# Altium schematic sheet DDR4_PWR - +VDDQ_+VTT_+VPP.schdoc
size 594 x 419 mm; Symbol: Sheet-Symbol_A3; Company: 嘉立创EDA; Version: V1.0; Page Size: A3; @Project Name: 【全网首发】X86电脑主板_copy; @Page Count: 28; @Update Date: 2025-10-09; @Create Date: 2025-10-09; @Schematic Name: SCHEMATIC1_1; @Page No: 0; @Page Name: DDR4_PWR - +VDDQ_+VTT_+VPP; Device: Sheet-Symbol_A3; Border: 1; Width: 2338; Height: 1652; Region Start: 1; X Region Count: 6; Y Region Count: 4; Blade Width: 10; Title Block Position: 3
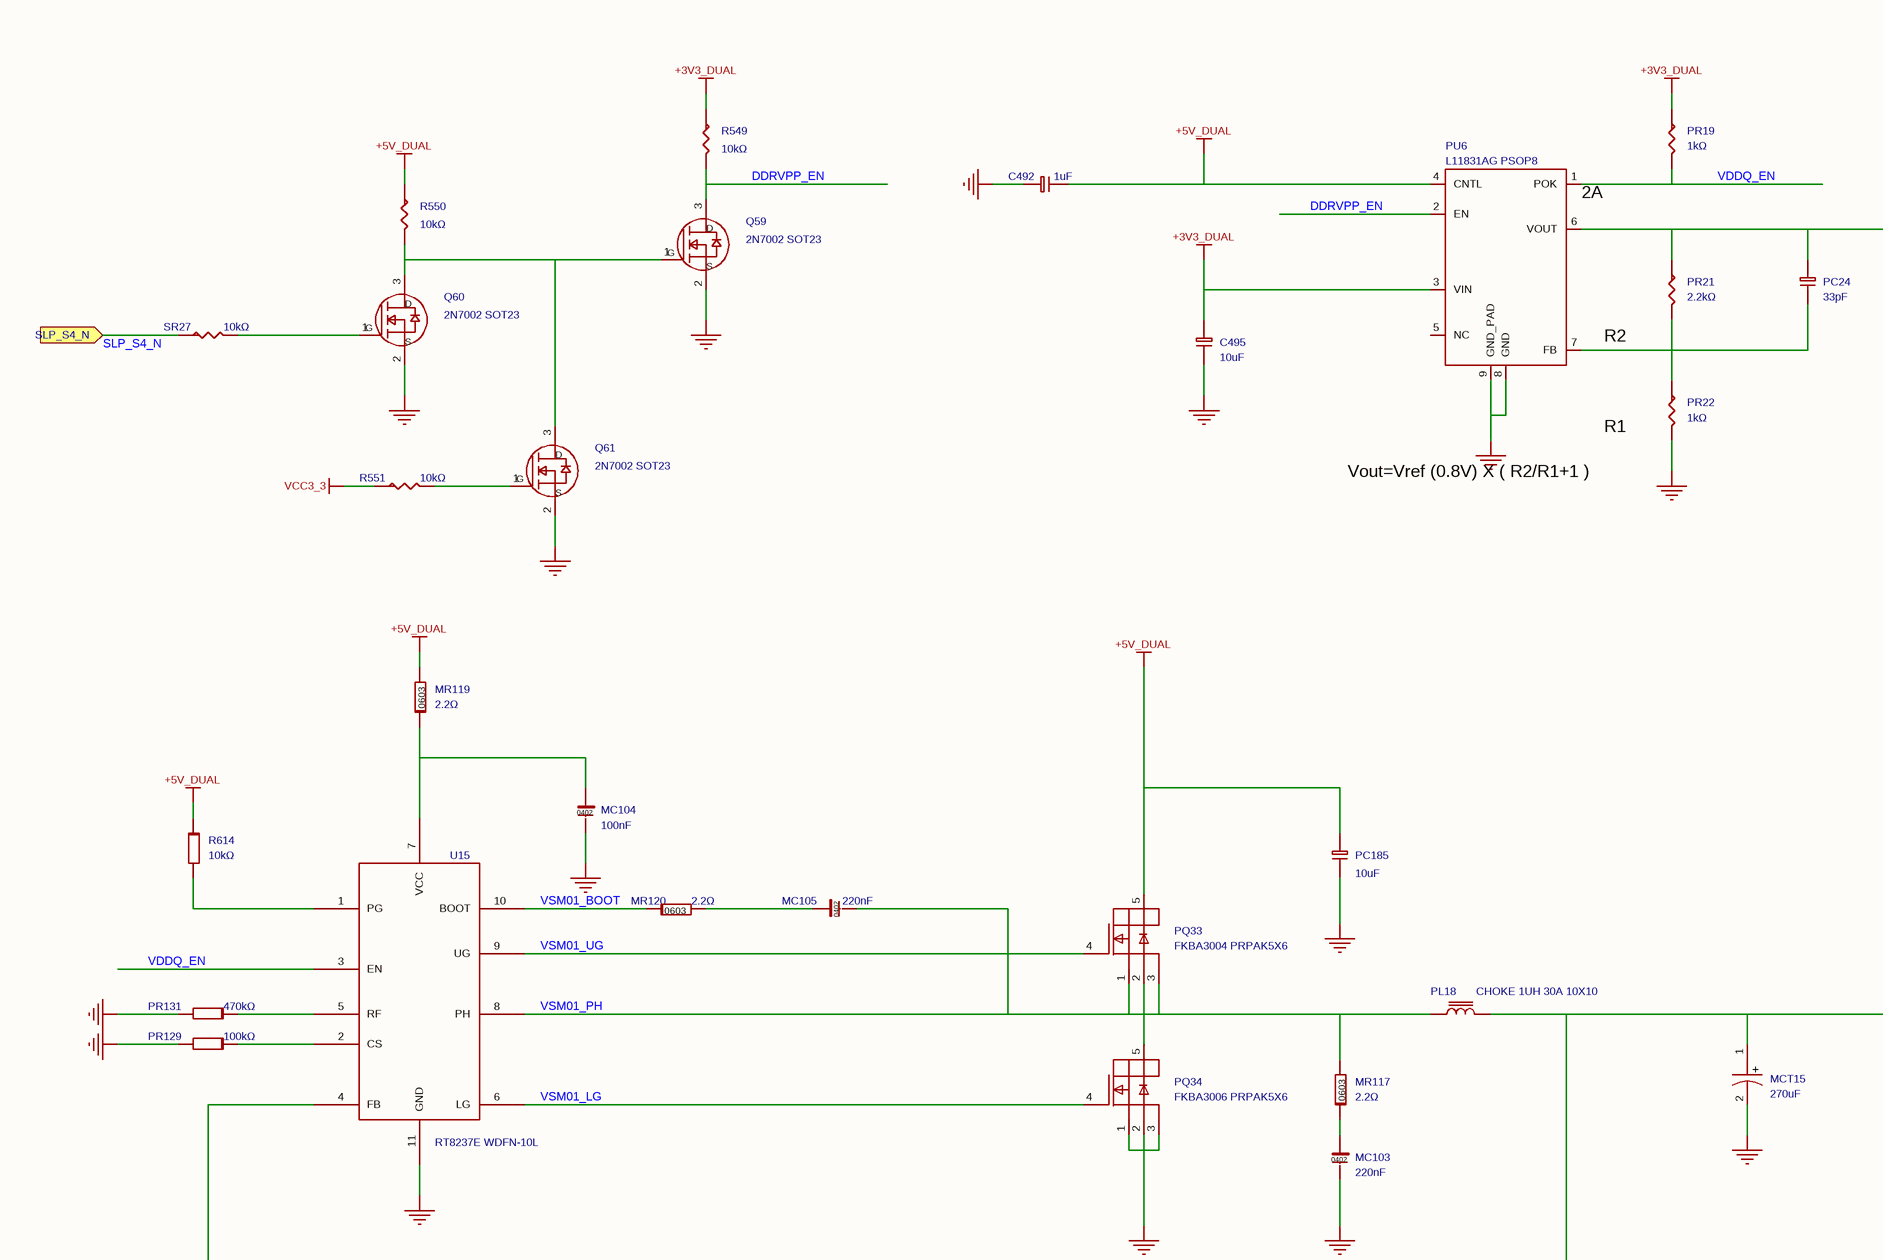
[diagram p0: DDR4_PWR - +VDDQ_+VTT_+VPP.schdoc, top left]
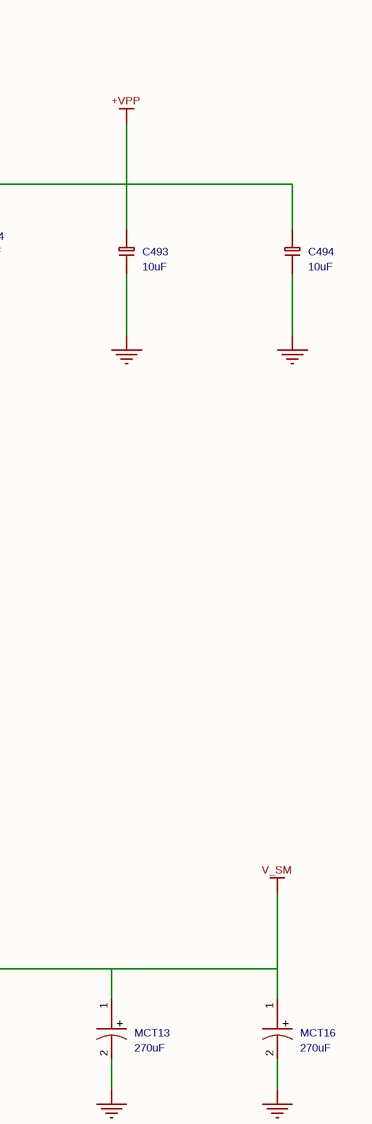
[diagram p1: DDR4_PWR - +VDDQ_+VTT_+VPP.schdoc, top right]
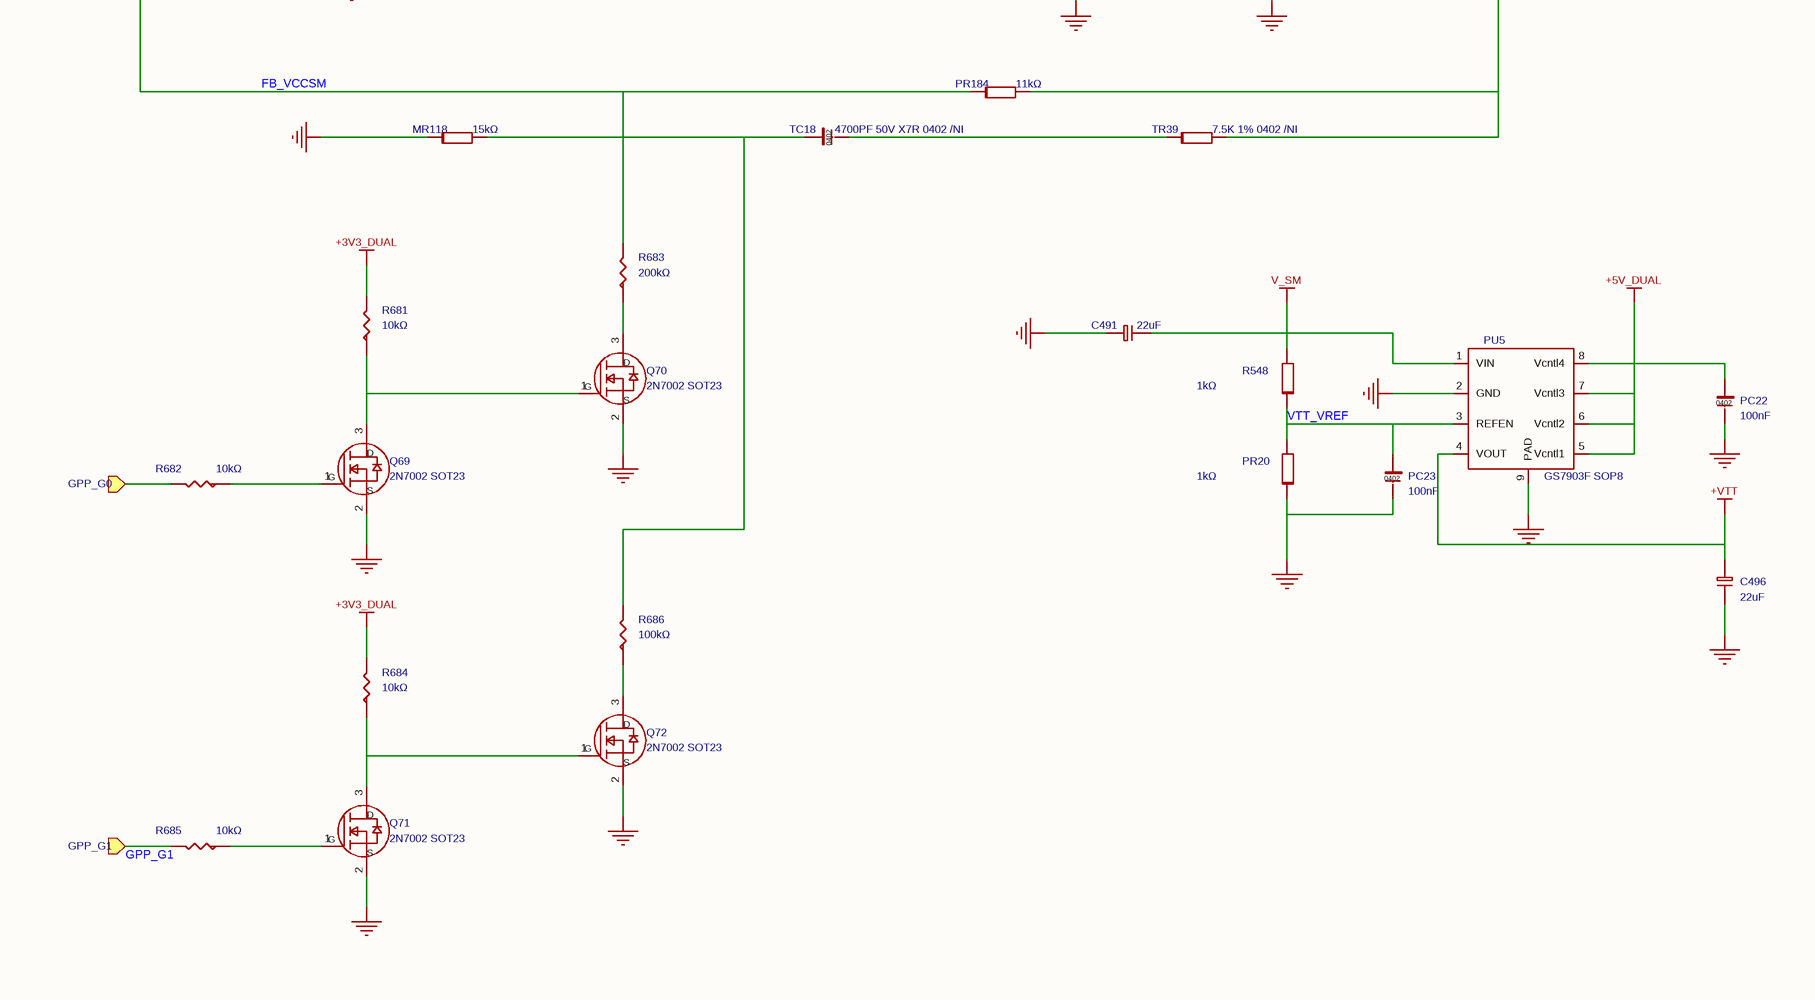
[diagram p2: DDR4_PWR - +VDDQ_+VTT_+VPP.schdoc, bottom left]

## Parts
C491  22uF  [C0603_1]
C492  1uF  [C0402_3]
C493  10uF  [C0603_2]
C494  10uF  [C0603_2]
C495  10uF  [C0603_1]
C496  22uF  [C0603_1]
MC103  220nF  [C0402_1]
MC104  100nF  [C0402_1]
MC105  220nF  [C0402_3]
MCT13  270uF  [EC1P25C_2]
MCT15  270uF  [EC1P25C_2]
MCT16  270uF  [EC1P25C_2]
MR117  2.2Ω  [R0603_1]
MR118  15kΩ  [R0402_3]
MR119  2.2Ω  [R0603_1]
MR120  2.2Ω  [R0603_1]
PC22  100nF  [C0402_3]
PC23  100nF  [C0402]
PC24  33pF  [C0402_2]
PC185  10uF  [C0805]
PL18  value CHOKE 1UH 30A 10X10  [MAGIC R22]  (hidden comment: L_L70-P50-H70)
PQ33  value FKBA3004 PRPAK5X6  [PRPAK5X6_2]  (hidden comment: PK616BA)
PQ34  value FKBA3006 PRPAK5X6  [PRPAK5X6]  (hidden comment: PK616BA)
PR19  1kΩ  [R0402_1]
PR20  1kΩ  [R0402]
PR21  2.2kΩ  [R0402_2]
PR22  1kΩ  [R0402_2]
PR129  100kΩ  [R0402_1]
PR131  470kΩ  [R0402]
PR184  11kΩ  [R0402]
PU5  value GS7903F SOP8  [SO8_50_150GV]  (hidden comment: RT9173D_4)
PU6  value L11831AG PSOP8  [SO8_50_150GV]  (hidden comment: RT9173B_0)
Q59  value 2N7002 SOT23  [SOT23_126]  (hidden comment: 2N7002)
Q60  value 2N7002 SOT23  [SOT23_125]  (hidden comment: 2N7002)
Q61  value 2N7002 SOT23  [SOT23_125]  (hidden comment: 2N7002)
Q69  value 2N7002 SOT23  [SOT23_125]  (hidden comment: 2N7002)
Q70  value 2N7002 SOT23  [SOT23_125]  (hidden comment: 2N7002)
Q71  value 2N7002 SOT23  [SOT23_125]  (hidden comment: 2N7002)
Q72  value 2N7002 SOT23  [SOT23_126]  (hidden comment: 2N7002)
R548  1kΩ  [R0402_3]
R549  10kΩ  [R0402_3]
R550  10kΩ  [R0402_1]
R551  10kΩ  [R0402_1]
R614  10kΩ  [R0402_3]
R681  10kΩ  [R0402_3]
R682  10kΩ  [R0402_3]
R683  200kΩ  [R0402_3]
R684  10kΩ  [R0402_3]
R685  10kΩ  [R0402_1]
R686  100kΩ  [R0402_3]
SR27  10kΩ  [R0402_3]
TC18  value 4700PF 50V X7R 0402 /NI  [C0402_1]  (hidden comment: C0402)
TR39  value 7.5K 1% 0402 /NI  [R0402_1]  (hidden comment: R0402)
U15  value RT8237E WDFN-10L  [DFN3X3-10-0-5]  (hidden comment: RT8237EZQW)

## Ports
GPP_G0 (in), GPP_G1 (in), SLP_S4_N (in)

## Nets
+3V3_DUAL: C495.1 PR19.1 PU6.3(VIN) R549.1 R681.2 R684.2
+5V_DUAL: C492.2 MR119.2 PC22.1 PC185.2 PQ33.5(DRAIN1) PU5.5(Vcntl1) PU5.6(Vcntl2) PU5.7(Vcntl3) PU5.8(Vcntl4) PU6.4(CNTL) R550.1 R614.1
+VPP: C493.1 C494.1 PC24.2 PR21.1 PU6.6(VOUT)
+VTT: C496.1 PU5.4(VOUT)
GND: C491.1 C492.1 C493.2 C494.2 C495.2 C496.2 MC103.2 MC104.2 MCT13.2 MCT15.2 MCT16.2 MR118.1 PC22.2 PC23.2 PC185.1 PQ34.1(SOURCE1) PQ34.2(SOURCE2) PQ34.3(SOURCE3) PR20.1 PR22.2 PR129.2 PR131.2 PU5.2(GND) PU5.9(PAD) PU6.8(GND) PU6.9(GND_PAD) Q59.2(S) Q60.2(S) Q61.2(S) Q69.2(S) Q70.2(S) Q71.2(S) Q72.2(S) U15.11(GND)
V_SM: C491.2 MCT13.1 MCT15.1 MCT16.1 PL18.2 PR184.2 PU5.1(VIN) R548.2 TR39.2
VCC3_3: R551.1
DDRVPP_EN: PU6.2(EN) Q59.3(D) R549.2
FB_VCCSM: MR118.2 PR184.1 R683.2 R686.2 TC18.1 U15.4(FB)
GPP_G0: R682.2 ; port GPP_G0
GPP_G1: R685.2 ; port GPP_G1
SLP_S4_N: SR27.1 ; port SLP_S4_N
VDDQ_EN: PR19.2 PU6.1(POK) U15.3(EN)
VSM01_BOOT: MR120.1 U15.10(BOOT)
VSM01_LG: PQ34.4(GATE) U15.6(LG)
VSM01_PH: MC105.2 MR117.2 PL18.1 PQ33.1(SOURCE1) PQ33.2(SOURCE2) PQ33.3(SOURCE3) PQ34.5(DRAIN1) U15.8(PH)
VSM01_UG: PQ33.4(GATE) U15.9(UG)
VTT_VREF: PC23.1 PR20.2 PU5.3(REFEN) R548.1
NetMC103_1: MC103.1 MR117.1
NetMC104_1: MC104.1 MR119.1 U15.7(VCC)
NetMC105_1: MC105.1 MR120.2
NetPC24_1: PC24.1 PR21.2 PR22.1 PU6.7(FB)
NetPR129_1: PR129.1 U15.2(CS)
NetPR131_1: PR131.1 U15.5(RF)
NetQ59_1: Q59.1(G) Q60.3(D) Q61.3(D) R550.2
NetQ60_1: Q60.1(G) SR27.2
NetQ61_1: Q61.1(G) R551.2
NetQ69_1: Q69.1(G) R682.1
NetQ69_3: Q69.3(D) Q70.1(G) R681.1
NetQ70_3: Q70.3(D) R683.1
NetQ71_1: Q71.1(G) R685.1
NetQ71_3: Q71.3(D) Q72.1(G) R684.1
NetQ72_3: Q72.3(D) R686.1
NetR614_2: R614.2 U15.1(PG)
NetTC18_2: TC18.2 TR39.1

Not connected (* = marked no-connect by the designer): PU6 5(NC)

## Notes on the sheet
- (near PU6) 2A
- R2
- R1
- Vout=Vref (0.8V) X ( R2/R1+1 )
- 更新日期
- 2025-10-09
- 原理图
- 图页
- SCHEMATIC1_1
- DDR4_PWR - +VDDQ_+VTT_+VPP
- 创建日期
- 物料编码
- 审阅
- 绘制
- 【全网首发】X86电脑主板_copy
- 版本
- V1.0
- 尺寸
- A3
- 页
- 0
- 嘉立创EDA
- 共
- 28
- 1
- (in symbol 160AREC271M0609) +

## Library data of the parts
C491 C496 = CL10A226MQ8NRNC_1: 容值:22uF;精度:±20%;额定电压:6.3V;材质(温度系数):X5R;; Manufacturer: SAMSUNG(三星); Symbol: CAP; PCB Footprint: C0603; Tolerance: ±20%; ModelId: ac125912035d415993ca9572d50418b1; AddInBom: yes; Voltage Rated: 6.3V; ModelName: C0603_L1.6-W0.8-H0.8; ModelTransform: 62.992,31.496,0,0,0,0,0,0,0; Temperature Coefficient: X5R; Device: CL10A226MQ8NRNC_1; Value: 22uF; Supplier: LCSC; Datasheet: https://atta.szlcsc.com/upload/public/pdf/source/20160103/1457707740762.pdf; FootprintName: C0603_1; SupplierPart: C59461; ConvertToPcb: yes; LCSC Part Name: 22uF ±20% 6.3V; JLCPCB Part Class: Basic Part; ManufacturerPart: CL10A226MQ8NRNC; Supplier Footprint: 0603
C492 = CL05A105KA5NQNC: 容值:1uF;精度:±10%;额定电压:25V;材质(温度系数):X5R;; Manufacturer: SAMSUNG(三星); Symbol: CAP; PCB Footprint: C0402; Tolerance: ±10%; ModelId: 36a51122f27c49738f86b3bfa98863e0; AddInBom: yes; Voltage Rated: 25V; ModelName: C0402_L1.0-W0.5-H0.5; ModelTransform: 39.37,19.685,0,0,0,0,0,0,0; Temperature Coefficient: X5R; Device: CL05A105KA5NQNC; Value: 1uF; Supplier: LCSC; Datasheet: https://atta.szlcsc.com/upload/public/pdf/source/20160103/1457707735223.pdf; FootprintName: C0402_3; SupplierPart: C52923; ConvertToPcb: yes; LCSC Part Name: 1uF ±10% 25V; JLCPCB Part Class: Basic Part; ManufacturerPart: CL05A105KA5NQNC; Supplier Footprint: 0402
C493-C495 = CL10A106MQ8NNNC: 容值:10uF;精度:±20%;额定电压:6.3V;材质(温度系数):X5R;; Manufacturer: SAMSUNG(三星); Symbol: CAP; PCB Footprint: C0603; Tolerance: ±20%; ModelId: ac125912035d415993ca9572d50418b1; AddInBom: yes; Voltage Rated: 6.3V; ModelName: C0603_L1.6-W0.8-H0.8; ModelTransform: 62.992,31.496,0,0,0,0,0,0,0; Temperature Coefficient: X5R; Device: CL10A106MQ8NNNC; Value: 10uF; Supplier: LCSC; Datasheet: https://atta.szlcsc.com/upload/public/pdf/source/20160103/1457707690948.pdf; SupplierPart: C1691; ConvertToPcb: yes; LCSC Part Name: 10uF ±20% 6.3V; JLCPCB Part Class: Extended Part; ManufacturerPart: CL10A106MQ8NNNC; Supplier Footprint: 0603
  C493 C494: FootprintName: C0603_2
  C495: FootprintName: C0603_1
MC103 MC105 = CL05B224KO5NNNC: 容值:220nF;精度:±10%;额定电压:16V;材质(温度系数):X7R;; Manufacturer: SAMSUNG(三星); Symbol: C0402; ModelId: 36a51122f27c49738f86b3bfa98863e0; Tolerance: ±10%; AddInBom: yes; Voltage Rated: 16V; ModelName: C0402_L1.0-W0.5-H0.5; ModelTransform: 39.37,19.685,0,0,0,0,0,0,0; Temperature Coefficient: X7R; Device: CL05B224KO5NNNC; Value: 220nF; Supplier: LCSC; Datasheet: https://atta.szlcsc.com/upload/public/pdf/source/20160103/1457707689724.pdf; SupplierPart: C16772; ConvertToPcb: yes; LCSC Part Name: 220nF ±10% 16V; JLCPCB Part Class: Basic Part; ManufacturerPart: CL05B224KO5NNNC; Supplier Footprint: 0402
  MC103: FootprintName: C0402_1
  MC105: FootprintName: C0402_3
MC104 PC22 = CL05B104KO5NNNC: 容值:100nF;精度:±10%;额定电压:16V;材质(温度系数):X7R;; Manufacturer: SAMSUNG(三星); Symbol: C0402; ModelId: 36a51122f27c49738f86b3bfa98863e0; Tolerance: ±10%; AddInBom: yes; Voltage Rated: 16V; ModelName: C0402_L1.0-W0.5-H0.5; ModelTransform: 39.37,19.685,0,0,0,0,0,0,0; Temperature Coefficient: X7R; Device: CL05B104KO5NNNC; Value: 100nF; Supplier: LCSC; Datasheet: https://atta.szlcsc.com/upload/public/pdf/source/20160103/1457707674891.pdf; SupplierPart: C1525; ConvertToPcb: yes; LCSC Part Name: 100nF ±10% 16V; JLCPCB Part Class: Basic Part; ManufacturerPart: CL05B104KO5NNNC; Supplier Footprint: 0402
  MC104: FootprintName: C0402_1
  PC22: FootprintName: C0402_3
MCT13 MCT15 MCT16 = 160AREC271M0609: 容值:270uF;精度:±20%;额定电压:16V;纹波电流:3.8A@100kHz;等效串联电阻:15mΩ@100kHz~300kHz;类型:-;; Manufacturer: APAQ(钰邦); Symbol: CAPACITOR POL_0; AddInBom: yes; ModelId: 0a4db4bf24b443b3be4905be97ff10c5; ModelName: CAP-TH_BD6.3-P2.50-D1.0-FD; ModelTransform: 248.4247,247.99777,0,0,0,0,0,0,-137.795; Tolerance: ±20%; Rated Voltage: 16V; φD: 6.3mm; L: 9mm; Lifetime @ Temp: 2000hrs@105℃; Device: 160AREC271M0609; Value: 270uF; LCSC Part Name: 270uF ±20% 16V; SupplierPart: C176312; ManufacturerPart: 160AREC271M0609; Supplier Footprint: 插件,D6.3xL9mm; JLCPCB Part Class: Extended Part; Datasheet: https://atta.szlcsc.com/upload/public/pdf/source/20180420/C176312_A6CC051F3F5535015096354530D22B11.pdf; Supplier: LCSC; ConvertToPcb: yes; FootprintName: EC1P25C_2; Ripple Current: 3.8A@100kHz; Equivalent Series Resistance(ESR): 15mΩ@100kHz~300kHz; Type: -; Lead Spacing: 2.5mm; Operating Temperature: -55℃~+105℃
MR117 MR119 MR120 = 0603WAF220KT5E: 电阻类型:厚膜电阻;阻值:2.2Ω;精度:±1%;功率:100mW;; Manufacturer: UNI-ROYAL(厚声); Symbol: R0603; ModelId: fc143cca1e79419f9cd78b61e9279f08; Tolerance: ±1%; AddInBom: yes; Power(Watts): 100mW; ModelTransform: 31.8897,63.7794,0,90,0,0,0,0,0; Overload Voltage (Max): 75V; Temperature Coefficient: ±400ppm/℃; Device: 0603WAF220KT5E; Value: 2.2Ω; Type: 厚膜电阻; Supplier: LCSC; Datasheet: https://atta.szlcsc.com/upload/public/pdf/source/20200306/C422600_1E6D84923E4A46A82E41ADD87F860B5C.pdf; FootprintName: R0603_1; SupplierPart: C22939; ModelName: R0603; ConvertToPcb: yes; LCSC Part Name: 2.2Ω ±1% 100mW; JLCPCB Part Class: Basic Part; ManufacturerPart: 0603WAF220KT5E; Supplier Footprint: 0603; Operating Temperature Range: -55℃~+155℃
MR118 = 0402WGF1502TCE: 电阻类型:厚膜电阻;阻值:15kΩ;精度:±1%;功率:62.5mW;; Manufacturer: UNI-ROYAL(厚声); Symbol: R0402; ModelId: 671aefced39d4c318694bba8bd8efd39; Tolerance: ±1%; AddInBom: yes; Power(Watts): 62.5mW; ModelName: R0402_L1.0-W0.5-H0.5; ModelTransform: 39.37,19.685,0,0,0,0,0,0.0005,0; Overload Voltage (Max): 50V; Temperature Coefficient: ±100ppm/℃; Device: 0402WGF1502TCE; Value: 15kΩ; Type: 厚膜电阻; Supplier: LCSC; Datasheet: https://atta.szlcsc.com/upload/public/pdf/source/20200306/C422600_1E6D84923E4A46A82E41ADD87F860B5C.pdf; FootprintName: R0402_3; SupplierPart: C25756; ConvertToPcb: yes; LCSC Part Name: 15kΩ ±1% 62.5mW; JLCPCB Part Class: Basic Part; ManufacturerPart: 0402WGF1502TCE; Supplier Footprint: 0402; Operating Temperature Range: -55℃~+155℃
PC23 = CL05B104KO5NNNC: 容值:100nF;精度:±10%;额定电压:16V;材质(温度系数):X7R;; Manufacturer: SAMSUNG(三星); ModelId: 36a51122f27c49738f86b3bfa98863e0; Tolerance: ±10%; AddInBom: yes; Voltage Rated: 16V; ModelName: C0402_L1.0-W0.5-H0.5; ModelTransform: 39.37,19.685,0,0,0,0,0,0,0; Temperature Coefficient: X7R; Device: CL05B104KO5NNNC; Symbol: C0402; Value: 100nF; Supplier: LCSC; Datasheet: https://atta.szlcsc.com/upload/public/pdf/source/20160103/1457707674891.pdf; FootprintName: C0402; SupplierPart: C1525; ConvertToPcb: yes; LCSC Part Name: 100nF ±10% 16V; JLCPCB Part Class: Basic Part; ManufacturerPart: CL05B104KO5NNNC; Supplier Footprint: 0402
PC24 = CC0402JRNPO9BN330: 容值:33pF;精度:±5%;额定电压:50V;材质(温度系数):NP0;; Manufacturer: YAGEO(国巨); Symbol: C-0603_3; ModelId: 36a51122f27c49738f86b3bfa98863e0; Tolerance: ±5%; AddInBom: yes; Voltage Rated: 50V; ModelName: C0402_L1.0-W0.5-H0.5; ModelTransform: 39.37,19.685,0,0,0,0,0,0,0; Temperature Coefficient: NP0; Device: CC0402JRNPO9BN330; Value: 33pF; Supplier: LCSC; Datasheet: https://atta.szlcsc.com/upload/public/pdf/source/20171026/C107005_15089856307561059550.pdf; FootprintName: C0402_2; SupplierPart: C107005; ConvertToPcb: yes; LCSC Part Name: 33pF ±5% 50V; JLCPCB Part Class: Extended Part; ManufacturerPart: CC0402JRNPO9BN330; Supplier Footprint: 0402
PC185 = CL21A106KOQNNNE: 容值:10uF;精度:±10%;额定电压:16V;材质(温度系数):X5R;; Manufacturer: SAMSUNG(三星); Symbol: CAP NP_31; ModelId: 1ba041120af144c991958decab20d241; Tolerance: ±10%; AddInBom: yes; Voltage Rated: 16V; ModelName: C0805_L2.0-W1.3-H1.3; ModelTransform: 78.74,51.181,0,0,0,0,0,0.0005,0; Temperature Coefficient: X5R; Device: CL21A106KOQNNNE; Value: 10uF; Supplier: LCSC; Datasheet: https://atta.szlcsc.com/upload/public/pdf/source/20160103/1457707694240.pdf; FootprintName: C0805; SupplierPart: C1713; ConvertToPcb: yes; LCSC Part Name: 10uF ±10% 16V; JLCPCB Part Class: Extended Part; ManufacturerPart: CL21A106KOQNNNE; Supplier Footprint: 0805
PL18 = L_L70-P50-H70_3: R80 直插一体成型电感; Check: false; AddInBom: yes; Device: L_L70-P50-H70_3; Symbol: L_L70-P50-H70; FootprintName: MAGIC R22; ConvertToPcb: yes
PQ33 PQ34 = PK616BA: 类型:1个N沟道;漏源电压(Vdss):30V;连续漏极电流(Id):50A;功率(Pd):31W;导通电阻(RDS(on)@Vgs,Id):9.5mΩ@4.5V,13A;阈值电压(Vgs(th)@Id):3V@250uA;; Manufacturer: NIKO-SEM(尼克森); Symbol: MOS-N_SO8_3; AddInBom: yes; ModelId: 178189b27e7544aca50c111426555358; ModelName: PDFN-8_L4.9-W5.8-H1.0-P1.27; ModelTransform: 200.787,240.157,0,0,0,0,-0.097,0,0; Drain Source Voltage (Vdss): 30V; Continuous Drain Current (Id): 50A; Power Dissipation (Pd): 31W; Device: PK616BA; LCSC Part Name: 1个N沟道 耐压:30V 电流:50A; SupplierPart: C133608; ManufacturerPart: PK616BA; Supplier Footprint: PDFN-8(5.8x4.9); JLCPCB Part Class: Extended Part; Datasheet: https://atta.szlcsc.com/upload/public/pdf/source/20170930/C133608_1506736454344997453.pdf; Supplier: LCSC; ConvertToPcb: yes; Type: 1个N沟道; Drain Source On Resistance (RDS(on)@Vgs,Id): 9.5mΩ@4.5V,13A; Gate Threshold Voltage (Vgs(th)@Id): 3V@250uA
  PQ33: FootprintName: PRPAK5X6_2
  PQ34: FootprintName: PRPAK5X6
PR19 PR22 = 0402WGF1001TCE: 电阻类型:厚膜电阻;阻值:1kΩ;精度:±1%;功率:62.5mW;; Manufacturer: UNI-ROYAL(厚声); Symbol: R-0603; ModelId: 671aefced39d4c318694bba8bd8efd39; Tolerance: ±1%; AddInBom: yes; Power(Watts): 62.5mW; ModelName: R0402_L1.0-W0.5-H0.5; ModelTransform: 39.37,19.685,0,0,0,0,0,0.0005,0; Overload Voltage (Max): 50V; Temperature Coefficient: ±100ppm/℃; Device: 0402WGF1001TCE; Value: 1kΩ; Type: 厚膜电阻; Supplier: LCSC; Datasheet: https://atta.szlcsc.com/upload/public/pdf/source/20200306/C422600_1E6D84923E4A46A82E41ADD87F860B5C.pdf; SupplierPart: C11702; ConvertToPcb: yes; LCSC Part Name: 1kΩ ±1% 62.5mW; JLCPCB Part Class: Basic Part; ManufacturerPart: 0402WGF1001TCE; Supplier Footprint: 0402; Operating Temperature Range: -55℃~+155℃
  PR19: FootprintName: R0402_1
  PR22: FootprintName: R0402_2
PR20 = 0402WGF1001TCE: 电阻类型:厚膜电阻;阻值:1kΩ;精度:±1%;功率:62.5mW;; Manufacturer: UNI-ROYAL(厚声); ModelId: 671aefced39d4c318694bba8bd8efd39; Tolerance: ±1%; AddInBom: yes; Power(Watts): 62.5mW; ModelName: R0402_L1.0-W0.5-H0.5; ModelTransform: 39.37,19.685,0,0,0,0,0,0.0005,0; Overload Voltage (Max): 50V; Temperature Coefficient: ±100ppm/℃; Device: 0402WGF1001TCE; Symbol: R0402; Value: 1kΩ; Type: 厚膜电阻; Supplier: LCSC; Datasheet: https://atta.szlcsc.com/upload/public/pdf/source/20200306/C422600_1E6D84923E4A46A82E41ADD87F860B5C.pdf; FootprintName: R0402; SupplierPart: C11702; ConvertToPcb: yes; LCSC Part Name: 1kΩ ±1% 62.5mW; JLCPCB Part Class: Basic Part; ManufacturerPart: 0402WGF1001TCE; Supplier Footprint: 0402; Operating Temperature Range: -55℃~+155℃
PR21 = 0402WGF2201TCE: 电阻类型:厚膜电阻;阻值:2.2kΩ;精度:±1%;功率:62.5mW;; Manufacturer: UNI-ROYAL(厚声); Symbol: R-0603; ModelId: 671aefced39d4c318694bba8bd8efd39; Tolerance: ±1%; AddInBom: yes; Power(Watts): 62.5mW; ModelName: R0402_L1.0-W0.5-H0.5; ModelTransform: 39.37,19.685,0,0,0,0,0,0.0005,0; Overload Voltage (Max): 50V; Temperature Coefficient: ±100ppm/℃; Device: 0402WGF2201TCE; Value: 2.2kΩ; Type: 厚膜电阻; Supplier: LCSC; Datasheet: https://atta.szlcsc.com/upload/public/pdf/source/20200306/C422600_1E6D84923E4A46A82E41ADD87F860B5C.pdf; FootprintName: R0402_2; SupplierPart: C25879; ConvertToPcb: yes; LCSC Part Name: 2.2kΩ ±1% 62.5mW; JLCPCB Part Class: Basic Part; ManufacturerPart: 0402WGF2201TCE; Supplier Footprint: 0402; Operating Temperature Range: -55℃~+155℃
PR129 = 0402WGF1003TCE: 电阻类型:厚膜电阻;阻值:100kΩ;精度:±1%;功率:62.5mW;; Manufacturer: UNI-ROYAL(厚声); Symbol: R0402; ModelId: 671aefced39d4c318694bba8bd8efd39; Tolerance: ±1%; AddInBom: yes; Power(Watts): 62.5mW; ModelName: R0402_L1.0-W0.5-H0.5; ModelTransform: 39.37,19.685,0,0,0,0,0,0.0005,0; Overload Voltage (Max): 50V; Temperature Coefficient: ±100ppm/℃; Device: 0402WGF1003TCE; Value: 100kΩ; Type: 厚膜电阻; Supplier: LCSC; Datasheet: https://atta.szlcsc.com/upload/public/pdf/source/20200306/C422600_1E6D84923E4A46A82E41ADD87F860B5C.pdf; FootprintName: R0402_1; SupplierPart: C25741; ConvertToPcb: yes; LCSC Part Name: 100kΩ ±1% 62.5mW; JLCPCB Part Class: Basic Part; ManufacturerPart: 0402WGF1003TCE; Supplier Footprint: 0402; Operating Temperature Range: -55℃~+155℃
PR131 = 0402WGF4703TCE: 电阻类型:厚膜电阻;阻值:470kΩ;精度:±1%;功率:62.5mW;; Manufacturer: UNI-ROYAL(厚声); ModelId: 671aefced39d4c318694bba8bd8efd39; Tolerance: ±1%; AddInBom: yes; Power(Watts): 62.5mW; ModelName: R0402_L1.0-W0.5-H0.5; ModelTransform: 39.37,19.685,0,0,0,0,0,0.0005,0; Overload Voltage (Max): 50V; Temperature Coefficient: ±100ppm/℃; Device: 0402WGF4703TCE; Symbol: R0402; Value: 470kΩ; Type: 厚膜电阻; Supplier: LCSC; Datasheet: https://atta.szlcsc.com/upload/public/pdf/source/20200306/C422600_1E6D84923E4A46A82E41ADD87F860B5C.pdf; FootprintName: R0402; SupplierPart: C25790; ConvertToPcb: yes; LCSC Part Name: 470kΩ ±1% 62.5mW; JLCPCB Part Class: Basic Part; ManufacturerPart: 0402WGF4703TCE; Supplier Footprint: 0402; Operating Temperature Range: -55℃~+155℃
PR184 = 0402WGF1102TCE: 电阻类型:厚膜电阻;阻值:11kΩ;精度:±1%;功率:62.5mW;; Manufacturer: UNI-ROYAL(厚声); ModelId: 671aefced39d4c318694bba8bd8efd39; Tolerance: ±1%; AddInBom: yes; Power(Watts): 62.5mW; ModelName: R0402_L1.0-W0.5-H0.5; ModelTransform: 39.37,19.685,0,0,0,0,0,0.0005,0; Overload Voltage (Max): 50V; Temperature Coefficient: ±100ppm/℃; Device: 0402WGF1102TCE; Symbol: R0402; Value: 11kΩ; Type: 厚膜电阻; Supplier: LCSC; Datasheet: https://atta.szlcsc.com/upload/public/pdf/source/20200306/C422600_1E6D84923E4A46A82E41ADD87F860B5C.pdf; FootprintName: R0402; SupplierPart: C25749; ConvertToPcb: yes; LCSC Part Name: 11kΩ ±1% 62.5mW; JLCPCB Part Class: Extended Part; ManufacturerPart: 0402WGF1102TCE; Supplier Footprint: 0402; Operating Temperature Range: -55℃~+155℃
PU5 = RT9173D_4: Check: false; AddInBom: yes; Device: RT9173D_4; Symbol: RT9173D_4; FootprintName: SO8_50_150GV; ConvertToPcb: yes
PU6 = RT9173B_1: Check: false; AddInBom: yes; Device: RT9173B_1; Symbol: RT9173B_0; FootprintName: SO8_50_150GV; ConvertToPcb: yes
Q59-Q61 Q69-Q72 = 2N7002_C8545: 类型:N沟道;漏源电压(Vdss):60V;连续漏极电流(Id):115mA;功率(Pd):200mW;导通电阻(RDS(on)@Vgs,Id):7.5Ω@10V,500mA;阈值电压(Vgs(th)@Id):2.5V@250uA;; Manufacturer: CJ(江苏长电/长晶); Symbol: NMOSFET SOT-23_0; Type: N沟道; ModelId: c62791f0466c4ae2a892c056b845b0ca; AddInBom: yes; ModelName: SOT-23-3P_L2.9-W1.3-H1.0-LS2.4-P0.95; ModelTransform: 98.425,114.173,0,180,0,0,0.0005,-0.0005,0; Power Dissipation (Pd): 200mW; Drain Source Voltage (Vdss): 60V; Continuous Drain Current (Id): 115mA; Device: 2N7002_C8545; Supplier: LCSC; Datasheet: https://atta.szlcsc.com/upload/public/pdf/source/20170302/1488422688078.pdf; SupplierPart: C8545; ConvertToPcb: yes; LCSC Part Name: N沟道 60V 115mA; JLCPCB Part Class: Basic Part; ManufacturerPart: 2N7002; Supplier Footprint: SOT-23; Gate Threshold Voltage (Vgs(th)@Id): 2.5V@250uA; Drain Source On Resistance (RDS(on)@Vgs,Id): 7.5Ω@10V,500mA
  Q59 Q72: FootprintName: SOT23_126
  Q60 Q61 Q69-Q71: FootprintName: SOT23_125
R548 = 0402WGF1001TCE: 电阻类型:厚膜电阻;阻值:1kΩ;精度:±1%;功率:62.5mW;; Manufacturer: UNI-ROYAL(厚声); Symbol: R0402; ModelId: 671aefced39d4c318694bba8bd8efd39; Tolerance: ±1%; AddInBom: yes; Power(Watts): 62.5mW; ModelName: R0402_L1.0-W0.5-H0.5; ModelTransform: 39.37,19.685,0,0,0,0,0,0.0005,0; Overload Voltage (Max): 50V; Temperature Coefficient: ±100ppm/℃; Device: 0402WGF1001TCE; Value: 1kΩ; Type: 厚膜电阻; Supplier: LCSC; Datasheet: https://atta.szlcsc.com/upload/public/pdf/source/20200306/C422600_1E6D84923E4A46A82E41ADD87F860B5C.pdf; FootprintName: R0402_3; SupplierPart: C11702; ConvertToPcb: yes; LCSC Part Name: 1kΩ ±1% 62.5mW; JLCPCB Part Class: Basic Part; ManufacturerPart: 0402WGF1001TCE; Supplier Footprint: 0402; Operating Temperature Range: -55℃~+155℃
R549-R551 = 0402WGF1002TCE: 电阻类型:厚膜电阻;阻值:10kΩ;精度:±1%;功率:62.5mW;; Manufacturer: UNI-ROYAL(厚声); Symbol: 42A**-F; PCB Footprint: R0402; ModelId: 671aefced39d4c318694bba8bd8efd39; Tolerance: ±1%; AddInBom: yes; Power(Watts): 62.5mW; ModelName: R0402_L1.0-W0.5-H0.5; ModelTransform: 39.37,19.685,0,0,0,0,0,0.0005,0; Overload Voltage (Max): 50V; Temperature Coefficient: ±100ppm/℃; Device: 0402WGF1002TCE; Value: 10kΩ; Type: 厚膜电阻; Supplier: LCSC; Datasheet: https://atta.szlcsc.com/upload/public/pdf/source/20200306/C422600_1E6D84923E4A46A82E41ADD87F860B5C.pdf; SupplierPart: C25744; ConvertToPcb: yes; LCSC Part Name: 10kΩ ±1% 62.5mW; JLCPCB Part Class: Basic Part; ManufacturerPart: 0402WGF1002TCE; Supplier Footprint: 0402; Operating Temperature Range: -55℃~+155℃
  R549: FootprintName: R0402_3
  R550 R551: FootprintName: R0402_1
R614 = 0402WGF1002TCE: 电阻类型:厚膜电阻;阻值:10kΩ;精度:±1%;功率:62.5mW;; Manufacturer: UNI-ROYAL(厚声); Symbol: R0402; ModelId: 671aefced39d4c318694bba8bd8efd39; Tolerance: ±1%; AddInBom: yes; Power(Watts): 62.5mW; ModelName: R0402_L1.0-W0.5-H0.5; ModelTransform: 39.37,19.685,0,0,0,0,0,0.0005,0; Overload Voltage (Max): 50V; Temperature Coefficient: ±100ppm/℃; Device: 0402WGF1002TCE; Value: 10kΩ; Type: 厚膜电阻; Supplier: LCSC; Datasheet: https://atta.szlcsc.com/upload/public/pdf/source/20200306/C422600_1E6D84923E4A46A82E41ADD87F860B5C.pdf; FootprintName: R0402_3; SupplierPart: C25744; ConvertToPcb: yes; LCSC Part Name: 10kΩ ±1% 62.5mW; JLCPCB Part Class: Basic Part; ManufacturerPart: 0402WGF1002TCE; Supplier Footprint: 0402; Operating Temperature Range: -55℃~+155℃
R681 R682 R684 R685 = 0402WGF1002TCE: 电阻类型:厚膜电阻;阻值:10kΩ;精度:±1%;功率:62.5mW;; Manufacturer: UNI-ROYAL(厚声); Symbol: RESISTOR; ModelId: 671aefced39d4c318694bba8bd8efd39; Tolerance: ±1%; AddInBom: yes; Power(Watts): 62.5mW; ModelName: R0402_L1.0-W0.5-H0.5; ModelTransform: 39.37,19.685,0,0,0,0,0,0.0005,0; Overload Voltage (Max): 50V; Temperature Coefficient: ±100ppm/℃; Device: 0402WGF1002TCE; Value: 10kΩ; Type: 厚膜电阻; Supplier: LCSC; Datasheet: https://atta.szlcsc.com/upload/public/pdf/source/20200306/C422600_1E6D84923E4A46A82E41ADD87F860B5C.pdf; SupplierPart: C25744; ConvertToPcb: yes; LCSC Part Name: 10kΩ ±1% 62.5mW; JLCPCB Part Class: Basic Part; ManufacturerPart: 0402WGF1002TCE; Supplier Footprint: 0402; Operating Temperature Range: -55℃~+155℃
  R681 R682 R684: FootprintName: R0402_3
  R685: FootprintName: R0402_1
R683 = 0402WGF2003TCE: 电阻类型:厚膜电阻;阻值:200kΩ;精度:±1%;功率:62.5mW;; Manufacturer: UNI-ROYAL(厚声); Symbol: RESISTOR; ModelId: 671aefced39d4c318694bba8bd8efd39; Tolerance: ±1%; AddInBom: yes; Power(Watts): 62.5mW; ModelName: R0402_L1.0-W0.5-H0.5; ModelTransform: 39.37,19.685,0,0,0,0,0,0.0005,0; Overload Voltage (Max): 50V; Temperature Coefficient: ±100ppm/℃; Device: 0402WGF2003TCE; Value: 200kΩ; Type: 厚膜电阻; Supplier: LCSC; Datasheet: https://atta.szlcsc.com/upload/public/pdf/source/20200306/C422600_1E6D84923E4A46A82E41ADD87F860B5C.pdf; FootprintName: R0402_3; SupplierPart: C25764; ConvertToPcb: yes; LCSC Part Name: 200kΩ ±1% 62.5mW; JLCPCB Part Class: Basic Part; ManufacturerPart: 0402WGF2003TCE; Supplier Footprint: 0402; Operating Temperature Range: -55℃~+155℃
R686 = 0402WGF1003TCE: 电阻类型:厚膜电阻;阻值:100kΩ;精度:±1%;功率:62.5mW;; Manufacturer: UNI-ROYAL(厚声); Symbol: RESISTOR; ModelId: 671aefced39d4c318694bba8bd8efd39; Tolerance: ±1%; AddInBom: yes; Power(Watts): 62.5mW; ModelName: R0402_L1.0-W0.5-H0.5; ModelTransform: 39.37,19.685,0,0,0,0,0,0.0005,0; Overload Voltage (Max): 50V; Temperature Coefficient: ±100ppm/℃; Device: 0402WGF1003TCE; Value: 100kΩ; Type: 厚膜电阻; Supplier: LCSC; Datasheet: https://atta.szlcsc.com/upload/public/pdf/source/20200306/C422600_1E6D84923E4A46A82E41ADD87F860B5C.pdf; FootprintName: R0402_3; SupplierPart: C25741; ConvertToPcb: yes; LCSC Part Name: 100kΩ ±1% 62.5mW; JLCPCB Part Class: Basic Part; ManufacturerPart: 0402WGF1003TCE; Supplier Footprint: 0402; Operating Temperature Range: -55℃~+155℃
SR27 = 0402WGF1002TCE: 电阻类型:厚膜电阻;阻值:10kΩ;精度:±1%;功率:62.5mW;; Manufacturer: UNI-ROYAL(厚声); Symbol: R-0603; ModelId: 671aefced39d4c318694bba8bd8efd39; Tolerance: ±1%; AddInBom: yes; Power(Watts): 62.5mW; ModelName: R0402_L1.0-W0.5-H0.5; ModelTransform: 39.37,19.685,0,0,0,0,0,0.0005,0; Overload Voltage (Max): 50V; Temperature Coefficient: ±100ppm/℃; Device: 0402WGF1002TCE; Value: 10kΩ; Type: 厚膜电阻; Supplier: LCSC; Datasheet: https://atta.szlcsc.com/upload/public/pdf/source/20200306/C422600_1E6D84923E4A46A82E41ADD87F860B5C.pdf; FootprintName: R0402_3; SupplierPart: C25744; ConvertToPcb: yes; LCSC Part Name: 10kΩ ±1% 62.5mW; JLCPCB Part Class: Basic Part; ManufacturerPart: 0402WGF1002TCE; Supplier Footprint: 0402; Operating Temperature Range: -55℃~+155℃
TC18 = C0402_1: Manufacturer: FH(风华); Manufacturer Part: 0402B472K500NT; 3D Model Transform: 39.37,19.685,0,0,0,0,0,0,0; Tolerance: ±10%; Voltage Rated: 50V; Temperature Coefficient: X7R; ModelId: 222a10e09e6e477a9f85628e277082cb; AddInBom: yes; Device: C0402_1; Symbol: C0402; LCSC Part Name: 4.7nF ±10% 50V; Supplier Part: C1538; Supplier Footprint: 0402; JLCPCB Part Class: Basic Part; Datasheet: https://atta.szlcsc.com/upload/public/pdf/source/20200305/C486355_26A10D38EF8C2A5C37091D0039909270.pdf; Supplier: LCSC; FootprintName: C0402_1; ModelName: C0402; ConvertToPcb: yes
TR39 = R0402: Manufacturer: UNI-ROYAL(厚声); Manufacturer Part: 0402WGF7501TCE; 3D Model: 671aefced39d4c318694bba8bd8efd39; Type: 厚膜电阻; Tolerance: ±1%; Power(Watts): 62.5mW; Overload Voltage (Max): 50V; Temperature Coefficient: ±100ppm/℃; AddInBom: yes; Device: R0402; Symbol: R0402; LCSC Part Name: 7.5kΩ ±1% 62.5mW 厚膜电阻; Supplier Part: C25918; Supplier Footprint: 0402; JLCPCB Part Class: Extended Part; Datasheet: https://atta.szlcsc.com/upload/public/pdf/source/20200306/C422600_1E6D84923E4A46A82E41ADD87F860B5C.pdf; Supplier: LCSC; Operating Temperature Range: -55℃~+155℃; ConvertToPcb: yes; FootprintName: R0402_1
U15 = RT8237EZQW: Manufacturer: RICHTEK(立锜); Symbol: uP6305 PSOP8_16; AddInBom: yes; ModelId: fa41748ee6fa4796aafe6110ca106f1f; ModelName: WDFN-10_L3.0-W3.0-H0.8-P0.50; ModelTransform: 118.11,118.8974,0,0,0,0,0,0,0; Device: RT8237EZQW; LCSC Part Name: High Efficiency Single Synchronous Buck PWM Controller; SupplierPart: C347517; ManufacturerPart: RT8237EZQW; Supplier Footprint: WDFN-10-EP(3x3); JLCPCB Part Class: Extended Part; Datasheet: https://atta.szlcsc.com/upload/public/pdf/source/20220608/C1907E879361D3C5D5346817D8A62D8C.pdf; Supplier: LCSC; ConvertToPcb: yes; FootprintName: DFN3X3-10-0-5